# Altium project PCB_Project.PrjPcb
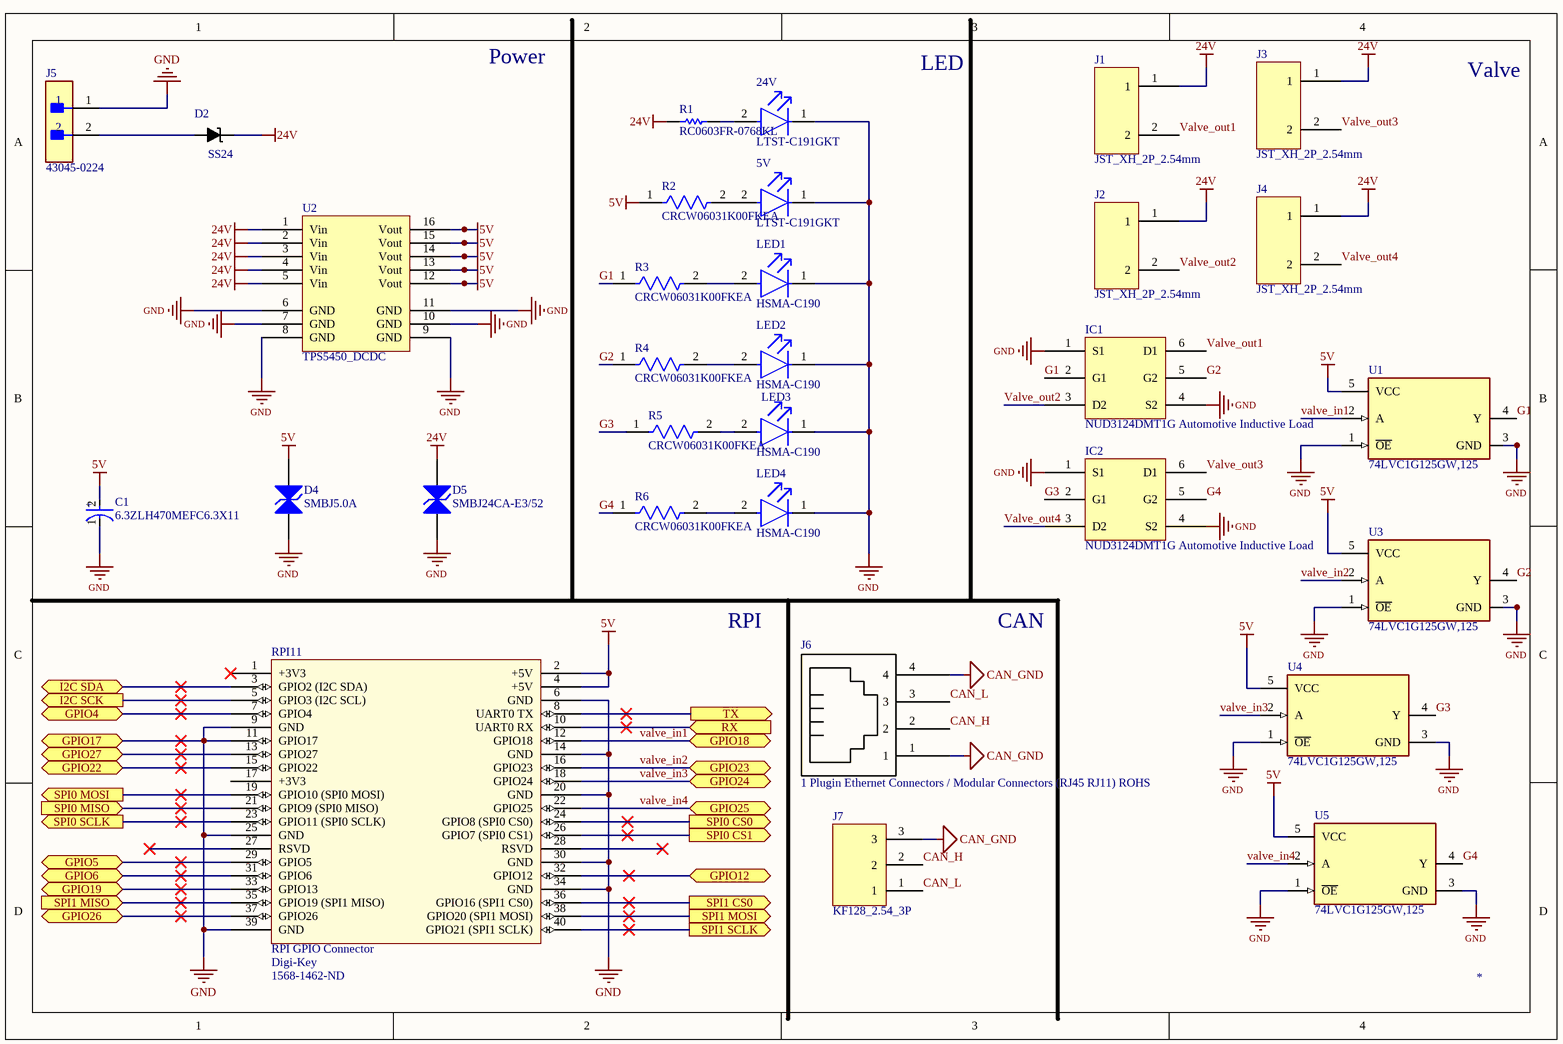
[diagram p0: RPI 3.SchDoc]
1 sheet, 31 parts. Net scope: flat (ports and power ports of the same name join across sheets).
Board file: RPI 3.PcbDoc

## Sheet RPI 3.SchDoc
size A4; SheetNumber: 1; SheetTotal: 1

### Parts
5V  LTST-C191GKT  [FP-LTST-C191GKT-MFG]
24V  LTST-C191GKT  [FP-LTST-C191GKT-MFG]
C1  6.3ZLH470MEFC6.3X11  [FP-6_3ZLH470MEFC6_3X11-MFG]
D2  SS24  [DO-214AC]
D4  SMBJ5.0A  [VISH-DO-214AA-A-2_V]
D5  SMBJ24CA-E3/52  [VISH-DO-214AA-A-2_V]
IC1  NUD3124DMT1G Automotive Inductive Load  [NUD3124DMT1G]
IC2  NUD3124DMT1G Automotive Inductive Load  [NUD3124DMT1G]
J1  JST_XH_2P_2.54mm  [JST_XH_2P_2.54mm]
J2  JST_XH_2P_2.54mm  [JST_XH_2P_2.54mm]
J3  JST_XH_2P_2.54mm  [JST_XH_2P_2.54mm]
J4  JST_XH_2P_2.54mm  [JST_XH_2P_2.54mm]
J5  43045-0224  [FP-43045-0224-MFG]
J6  1 Plugin Ethernet Connectors / Modular Connectors (RJ45 RJ11) ROHS  [RJ45_RJ11_955012441]
J7  KF128_2.54_3P  [KF128_3P_2.54mm]
LED1  HSMA-C190  [FP-HSMA-C190-MFG]
LED2  HSMA-C190  [FP-HSMA-C190-MFG]
LED3  HSMA-C190  [FP-HSMA-C190-MFG]
LED4  HSMA-C190  [FP-HSMA-C190-MFG]
R1  RC0603FR-0768KL  [RESC1608X55X25LL10T15]
R2  CRCW06031K00FKEA  [FP-CRCW0603-e3-MFG]
R3  CRCW06031K00FKEA  [FP-CRCW0603-e3-MFG]
R4  CRCW06031K00FKEA  [FP-CRCW0603-e3-MFG]
R5  CRCW06031K00FKEA  [FP-CRCW0603-e3-MFG]
R6  CRCW06031K00FKEA  [FP-CRCW0603-e3-MFG]
RPI11  RPI GPIO Connector  Supplier 1: Digi-Key  Supplier Part Number 1: 1568-1462-ND  [rpi]
U1  74LVC1G125GW,125  [FP-SOT353-1-IPC_A]
U2  TPS5450_DCDC  [TPS5450_DCDC]
U3  74LVC1G125GW,125  [FP-SOT353-1-IPC_A]
U4  74LVC1G125GW,125  [FP-SOT353-1-IPC_A]
U5  74LVC1G125GW,125  [FP-SOT353-1-IPC_A]

### Ports
GPIO4 (bidir), GPIO5 (bidir), GPIO6 (bidir), GPIO12 (bidir), GPIO17 (bidir), GPIO18 (bidir), GPIO19 (bidir), GPIO22 (bidir), GPIO23 (bidir), GPIO24 (bidir), GPIO25 (bidir), GPIO26 (bidir), GPIO27 (bidir), I2C SCK (out), I2C SDA (bidir), RX (in), SPI0 CS0 (out), SPI0 CS1 (out), SPI0 MISO (in), SPI0 MOSI (out), SPI0 SCLK (out), SPI1 CS0 (out), SPI1 MISO (in), SPI1 MOSI (out), SPI1 SCLK (out), TX (out)

### Nets
5V: C1.2(A) D4.1(A) R2.1 RPI11.2(+5V) RPI11.4(+5V) U1.5(VCC) U2.12(Vout) U2.13(Vout) U2.14(Vout) U2.15(Vout) U2.16(Vout) U3.5(VCC) U4.5(VCC) U5.5(VCC)
24V: D2.K(Cathode) D5.1(A) J1.1 J2.1 J3.1 J4.1 R1.1 U2.1(Vin) U2.2(Vin) U2.3(Vin) U2.4(Vin) U2.5(Vin)
CAN_GND: J6.1 J6.4 J7.3
GND: 5V.1(C) 24V.1(C) C1.1(C) D4.2(A) D5.2(A) IC1.1(S1) IC1.4(S2) IC2.1(S1) IC2.4(S2) J5.1 LED1.1(C) LED2.1(C) LED3.1(C) LED4.1(C) RPI11.6(GND) RPI11.9(GND) RPI11.11(GPIO17) RPI11.14(GND) RPI11.20(GND) RPI11.25(GND) RPI11.30(GND) RPI11.34(GND) RPI11.39(GND) U1.1(~{OE}) U1.3(GND) U2.6(GND) U2.7(GND) U2.8(GND) U2.9(GND) U2.10(GND) U2.11(GND) U3.1(~{OE}) U3.3(GND) U4.1(~{OE}) U4.3(GND) U5.1(~{OE}) U5.3(GND) ; port GPIO17
CAN_H: J6.2 J7.2
CAN_L: J6.3 J7.1
G1: IC1.2(G1) R3.1 U1.4(Y)
G2: IC1.5(G2) R4.1 U3.4(Y)
G3: IC2.2(G1) R5.1 U4.4(Y)
G4: IC2.5(G2) R6.1 U5.4(Y)
valve_in1: RPI11.12(GPIO18) U1.2(A) ; port GPIO18
valve_in2: RPI11.16(GPIO23) U3.2(A) ; port GPIO23
valve_in3: RPI11.18(GPIO24) U4.2(A) ; port GPIO24
valve_in4: RPI11.22(GPIO25) U5.2(A) ; port GPIO25
Valve_out1: IC1.6(D1) J1.2
Valve_out2: IC1.3(D2) J2.2
Valve_out3: IC2.6(D1) J3.2
Valve_out4: IC2.3(D2) J4.2
Net5V_2: 5V.2(A) R2.2
Net24V_2: 24V.2(A) R1.2
NetD2_A: D2.A(Anode) J5.2
NetLED1_2: LED1.2(A) R3.2
NetLED2_2: LED2.2(A) R4.2
NetLED3_2: LED3.2(A) R5.2
NetLED4_2: LED4.2(A) R6.2
NetRPI11_3: RPI11.3(GPIO2_(I2C_SDA)) ; port I2C SDA
NetRPI11_5: RPI11.5(GPIO3_(I2C_SCL)) ; port I2C SCK
NetRPI11_7: RPI11.7(GPIO4) ; port GPIO4
NetRPI11_8: RPI11.8(UART0_TX) ; port TX
NetRPI11_10: RPI11.10(UART0_RX) ; port RX
NetRPI11_13: RPI11.13(GPIO27) ; port GPIO27
NetRPI11_15: RPI11.15(GPIO22) ; port GPIO22
NetRPI11_19: RPI11.19(GPIO10_(SPI0_MOSI)) ; port SPI0 MOSI
NetRPI11_21: RPI11.21(GPIO9_(SPI0_MISO)) ; port SPI0 MISO
NetRPI11_23: RPI11.23(GPIO11_(SPI0_SCLK)) ; port SPI0 SCLK
NetRPI11_24: RPI11.24(GPIO8_(SPI0_CS0)) ; port SPI0 CS0
NetRPI11_26: RPI11.26(GPIO7_(SPI0_CS1)) ; port SPI0 CS1
NetRPI11_29: RPI11.29(GPIO5) ; port GPIO5
NetRPI11_31: RPI11.31(GPIO6) ; port GPIO6
NetRPI11_32: RPI11.32(GPIO12) ; port GPIO12
NetRPI11_33: RPI11.33(GPIO13) ; port GPIO19
NetRPI11_35: RPI11.35(GPIO19_(SPI1_MISO)) ; port SPI1 MISO
NetRPI11_36: RPI11.36(GPIO16_(SPI1_CS0)) ; port SPI1 CS0
NetRPI11_37: RPI11.37(GPIO26) ; port GPIO26
NetRPI11_38: RPI11.38(GPIO20_(SPI1_MOSI)) ; port SPI1 MOSI
NetRPI11_40: RPI11.40(GPIO21_(SPI1_SCLK)) ; port SPI1 SCLK

Not connected (* = marked no-connect by the designer): RPI11 1(+3V3)* 17(+3V3) 27(RSVD)* 28(RSVD)*

### Notes on the sheet
- Power
- LED
- Valve
- RPI
- CAN
- (in symbol CMP-35376-000018-1) +

### Library data of the parts
5V 24V = CMP-22017-000029-1: LED GREEN CLEAR CHIP SMD; Power Dissipation: 100mW; Lens Color: Colorless; Number of Elements: 1; Dominant Wavelength: 569nm; Forward Voltage: 2.1V; Forward Current: 30mA; Test Current: 20mA; Viewing Angle: 130°; Wavelength: 565nm; Luminous Intensity: 12mcd; Reverse Voltage: 5V; Case/Package: 0603; Package Quantity: 1; Illumination Color: Green; Lens Style: Clear; Lens Transparency: Clear; Depth: 0.8mm; Power Rating: 100mW; Width: 0.8mm; Height: 0.55mm; Radiation Hardening: No; Case Code (Imperial): 0603; Number of Pins: 2; Length: 1.6mm; Case Code (Metric): 1608; Max Operating Temperature: 85°C; Color: Green; Packaging: Tape and Reel; Mount: Surface Mount; Min Operating Temperature: -55°C; Lead Free: Lead Free; Number of LEDs: 1
C1 = CMP-35376-000018-1: CAP ALUM 470UF 20% 6.3V RADIAL; Life (Hours): 6000Hour; Leakage Current: 3uA; Ripple Current: 540mA; Impedance: 94mR; Lead Diameter: 0.5mm; Dielectric Material: Aluminium; Series: ZLH; Min Operating Temperature: -40°C; Max Operating Temperature: 105°C; Construction: RADIAL; Number of Pins: 2; Voltage Rating (DC): 6.3V; REACH SVHC: No SVHC; Height - Seated (Max): 0.492inch; RoHS Compliant: Yes; Ripple Current (AC): 540mA; Packaging: Bulk; Height: 11mm; Tolerance: 20%; Case/Package: Radial; Voltage: 6.3V; Capacitance: 470uF; Radiation Hardening: No; Mount: Through Hole; Package Quantity: 2000; Termination: Radial; Lead Pitch: 2.5mm; Diameter: 6.3mm; Voltage Rating: 6.3V
D2 = CMP-004-00032-1: 2.0A SURFACE MOUNT SCHOTTKY BARRIER RECTIFIER; Current: 2A; Voltage: 40V; Source: Power_board_2022.SCHLIB; Component Type: Standard; Pins: 2; Design Item ID: SS24; Component Type: Diodes
D4 D5 = SMBJ24CA-E3/52: TRANSZORB(R) Transient Voltage Suppressor, 24 V, -55 to 150 degC, 2-Pin DO-214AA (SMBJ), RoHS, Tape and Reel; Manufacturer: Vishay; Manufacturer: Vishay Semiconductors; Clamping Voltage Vc Max: 38.9V; Peak Pulse Current Ippm: 14A; Product Range: TRANSZORBSMBJSeries; Power Dissipation Pd: 600W; Breakdown Voltage Min: 26.7V; No. of Pins: 2Pins; SVHC: ToBeAdvised; Breakdown Voltage Max: 29.5V; TVS Polarity: Bidirectional; Reverse Stand-Off Voltage Vrwm: 24V; Mounting Technology: SurfaceMount; Package Reference: DO-214AA; Package Description: 2-Pin Surface Mount Device, Body 4.315 x 3.62 mm; Diode Case Style: DO-214AA; Packaging: CutTape; Datasheet URL: http://www.vishay.com/docs/88392/smbj50a.pdf; Peak Pulse Power Dissipation: 600W; Manufacturer URL: http://www.vishay.com/; Datasheet Version: 02/2014; Manufacturer Part Number: SMBJ24CA-E3/52
IC1 IC2 = NUD3124DMT1G: Dual-NMOSFET-IC
J5 = CMP-04776-000969-1: CONN HEADER VERT 2POS; Number of Circuits: 2; Pitch: 3mm; Voltage Rating: 600V; Voltage Rating (DC): 250V; Max Voltage Rating (DC): 250.25kV; Connector Type: Plug; Gender: Male; Glow Wire Compliant: Compliant; Current Rating: 5A; Contact Resistance: 10mR; Flammability Rating: UL94 V-0; Contact Gender: Male; Halogen Free: Low Halogen; Contact Material: Brass; Radiation Hardening: No; Number of Rows: 2; Packaging: Tray; Number of Positions: 2; Mount: Through Hole; Orientation: Vertical; Number of Contacts: 2; Min Operating Temperature: -40°C; Color: Black; Max Operating Temperature: 105°C; Housing Material: Thermoplastic; Row Spacing: 3mm; Package Quantity: 3168; Series: 43045; Contact Plating: Tin; RoHS Compliant: Yes; Termination: Through Hole
J6 = RJ45_RJ11_955012441
J7 = KF128_3P_2.54mm
LED1-LED4 = CMP-1744-00005-2: LED AMBER DIFFUSED CHIP SMD; Luminous Flux: 480lm; Voltage Rating (DC): 1.9V; Forward Current: 20mA; Reverse Voltage: 5V; Illumination Color: Orange; Wavelength: 592nm; Lens Color: White; Power Dissipation: 60mW; Luminous Intensity: 90mcd; Number of LEDs: 1; Viewing Angle: 170°; Number of Pins: 2; Lens Style: Diffused; Min Operating Temperature: -40°C; Max Operating Temperature: 85°C; Lens Transparency: Diffused; Packaging: Tape and Reel; Lead Free: Lead Free; Case Code (Metric): 1608; Package Quantity: 1; Radiation Hardening: No; Mount: Surface Mount; Width: 0.8mm; Contact Plating: Gold; Dominant Wavelength: 592nm; Max Power Dissipation: 60mW; Power Rating: 60mW; Height: 0.8mm; REACH SVHC: No SVHC; Forward Voltage: 1.9V; Case Code (Imperial): 0603; Color: Orange; Test Current: 20mA; Number of Elements: 1; Length: 1.6mm; Case/Package: 0603; Depth: 0.8mm
R1 = CMP-2000-06944-1: Chip Resistor, 68 KOhm, +/- 1%, 0.1 W, -55 to 155 degC, 0603 (1608 Metric), RoHS, Tape and Reel; Manufacturer: Yageo; Temperature Coefficient: 100PPM/C; Power Rating: 100mW; Resistance: 68kOhms; Voltage Rating: 50V; Termination Style: SMD/SMT; Case Code - mm: 1608; Mounting Technology: SurfaceMount; Packaging: Reel; Series: RC; Product: ThickFilmResistorsGeneralPurpose; Operating Temperature Range: -55Cto+155C; Datasheet URL: http://www.yageo.com/documents/recent/PYu-RC_Group_51_RoHS_L_7.pdf; Package Reference: 0603; Manufacturer URL: http://www.yageo.com/; Datasheet Version: Rev. 7, 05/2017; Package Description: 2-Pin Surface Mount Device, Body 1.6 x 0.8 mm; Case Code - in: 0603; Tolerance: 1%
R2-R6 = CMP-1666-00003-5: RES Thick Film, 1kΩ, 1%, 0.1W, 100ppm/°C, 0603; Max Power Dissipation: 100mW; Voltage Rating: 75V; Resistance: 1kR; Max Operating Temperature: 155°C; Number of Pins: 2; Case Code (Imperial): 0603; Width: 0.033inch; Power Rating: 100mW; Number of Terminations: 2; Package Quantity: 10; Weight: 7.1E-05oz; Tolerance: 1%; Temperature Coefficient: 100ppm/°C; Military Standard: Not; Mount: Surface Mount; Voltage Rating (DC): 75V; Depth: 0.85mm; Composition: Thick Film; Radiation Hardening: No; Termination: SMD/SMT; Length: 1.55mm; Case Code (Metric): 1608; Contact Plating: Tin; Min Operating Temperature: -55°C; Packaging: Tape and Reel; Height: 0.45mm; Lead Free: Lead Free; Case/Package: 0603; Features: Automotive AEC-Q200
RPI11 = rpi connector: GPIO Header for Raspberry Pi A+/B+/Pi 2/Pi 3 - 2x20; Manufacturer: SparkFun Electronics; Manufacturer Part Number: PRT-14017; Nils Minor: author; nilsminor@web.de: mail; RoHS: RoHS Compliant; Category: Development Boards, Kits, Programmers; Stock 1: 150; Pricing 1: 1=1.84 (EUR); Part Status: Active; Accessory Type: Connector; For Use With/Related Products: Raspberry Pi; ComponentLink1URL: https://cdn.sparkfun.com/datasheets/Dev/RaspberryPi/12313.pdf; ComponentLink1Description: https://cdn.sparkfun.com/datasheets/Dev/RaspberryPi/12313.pdf
U1 U3-U5 = CMP-14347-000004-1: IC BUF NON-INVERT 5.5V 5TSSOP
U2 = TPS5450_DCDC: TPS5450 DCDC module for HKU Robocon 2026 SIC